# Altium schematic sheet Top_Sheet.SchDoc
size A4; DocumentNumber: 1; SheetNumber: 1; SheetTotal: 7
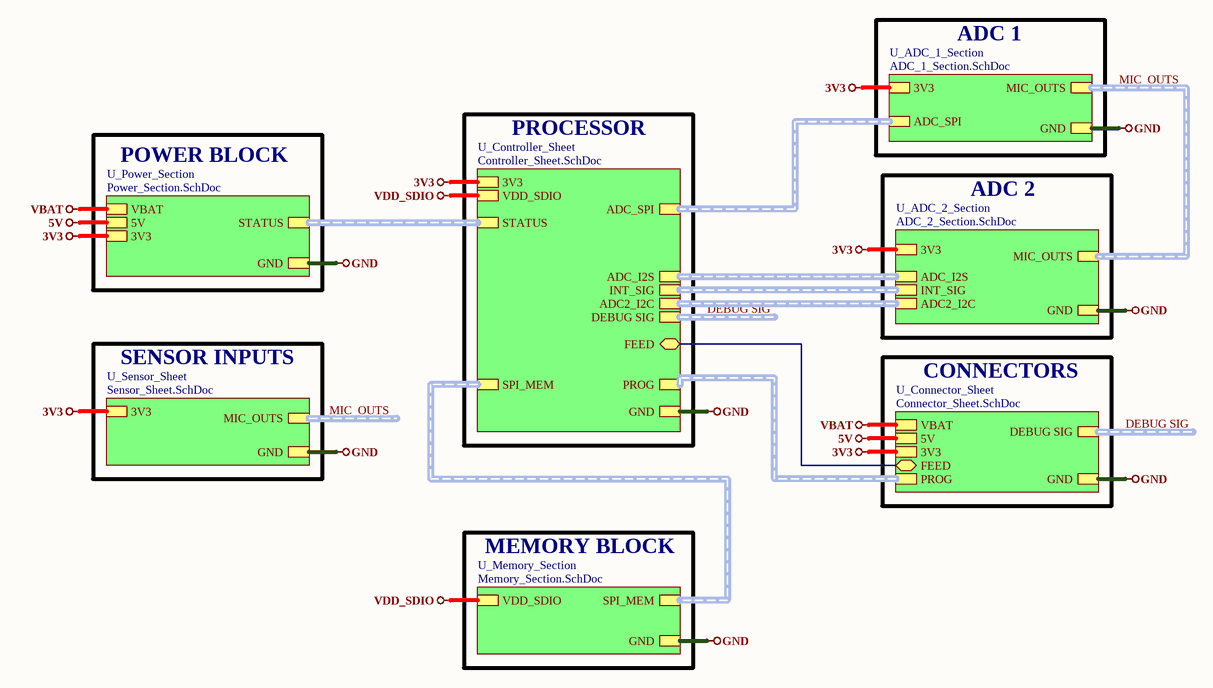
[diagram p0: Top_Sheet.SchDoc]

## Sub-sheets
U_ADC_1_Section = ADC_1_Section.SchDoc: MIC_OUTS (harness MIC_OUTS), ADC_SPI (harness ADC_SPI), 3V3, GND
U_ADC_2_Section = ADC_2_Section.SchDoc: MIC_OUTS (harness MIC_OUTS), ADC_I2S (harness ADC_I2S), INT_SIG (harness INT_SIG), 3V3, GND, ADC2_I2C (harness ADC2_I2C)
U_Connector_Sheet = Connector_Sheet.SchDoc: PROG (harness PROG), 3V3, GND, VBAT, 5V, FEED (bidir), DEBUG SIG (harness DEBUG SIG)
U_Controller_Sheet = Controller_Sheet.SchDoc: PROG (harness PROG), STATUS (harness STATUS), ADC_I2S (harness ADC_I2S), ADC_SPI (harness ADC_SPI), INT_SIG (harness INT_SIG), ADC2_I2C (harness ADC2_I2C), 3V3, GND, FEED (bidir), DEBUG SIG (harness DEBUG SIG), VDD_SDIO, SPI_MEM (harness SPI_MEM)
U_Memory_Section = Memory_Section.SchDoc: SPI_MEM (harness SPI_MEM), VDD_SDIO, GND
U_Power_Section = Power_Section.SchDoc: STATUS (harness STATUS), 3V3, GND, VBAT, 5V
U_Sensor_Sheet = Sensor_Sheet.SchDoc: MIC_OUTS (harness MIC_OUTS), 3V3, GND

## Nets
3V3: sheet U_Power_Section/3V3, sheet U_Controller_Sheet/3V3, sheet U_ADC_2_Section/3V3, sheet U_ADC_1_Section/3V3, sheet U_Sensor_Sheet/3V3, sheet U_Connector_Sheet/3V3
5V: sheet U_Power_Section/5V, sheet U_Connector_Sheet/5V
GND: sheet U_Power_Section/GND, sheet U_Controller_Sheet/GND, sheet U_ADC_2_Section/GND, sheet U_ADC_1_Section/GND, sheet U_Sensor_Sheet/GND, sheet U_Connector_Sheet/GND, sheet U_Memory_Section/GND
VBAT: sheet U_Power_Section/VBAT, sheet U_Connector_Sheet/VBAT
VDD_SDIO: sheet U_Controller_Sheet/VDD_SDIO, sheet U_Memory_Section/VDD_SDIO
(unnamed): sheet U_Controller_Sheet/FEED, sheet U_Connector_Sheet/FEED

## Buses and harness runs
harness DEBUG SIG = sheet U_Connector_Sheet/DEBUG SIG
harness DEBUG SIG = sheet U_Controller_Sheet/DEBUG SIG
harness MIC_OUTS = sheet U_ADC_1_Section/MIC_OUTS = sheet U_ADC_2_Section/MIC_OUTS
harness MIC_OUTS = sheet U_Sensor_Sheet/MIC_OUTS
harness sheet U_ADC_1_Section/ADC_SPI = sheet U_Controller_Sheet/ADC_SPI
harness sheet U_ADC_2_Section/ADC2_I2C = sheet U_Controller_Sheet/ADC2_I2C
harness sheet U_ADC_2_Section/ADC_I2S = sheet U_Controller_Sheet/ADC_I2S
harness sheet U_ADC_2_Section/INT_SIG = sheet U_Controller_Sheet/INT_SIG
harness sheet U_Connector_Sheet/PROG = sheet U_Controller_Sheet/PROG
harness sheet U_Controller_Sheet/SPI_MEM = sheet U_Memory_Section/SPI_MEM
harness sheet U_Controller_Sheet/STATUS = sheet U_Power_Section/STATUS

## Notes on the sheet
- ADC 1
- POWER BLOCK
- PROCESSOR
- ADC 2
- SENSOR INPUTS
- CONNECTORS
- MEMORY BLOCK
- 1
- Huzaifa Ali